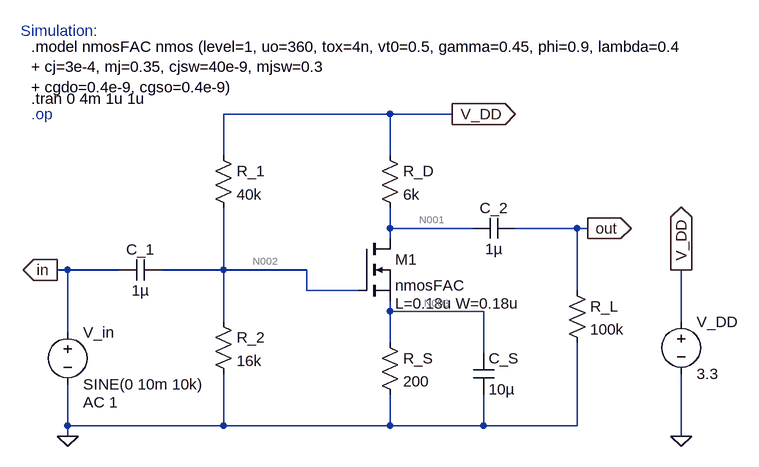
[diagram p0: schematic Homework 3 - Simulation.asc]
Homework 3 - Simulation.asc, the LTspice schematic file:
Version 4
SHEET 1 1324 680
WIRE 528 -176 272 -176
WIRE 624 -176 528 -176
WIRE 272 -112 272 -176
WIRE 528 -112 528 -176
WIRE 528 0 528 -32
WIRE 656 0 528 0
WIRE 816 0 720 0
WIRE 832 0 816 0
WIRE 528 16 528 0
WIRE 32 64 16 64
WIRE 112 64 32 64
WIRE 272 64 272 -32
WIRE 272 64 176 64
WIRE 400 64 272 64
WIRE 400 96 400 64
WIRE 480 96 400 96
WIRE 816 96 816 0
WIRE 528 128 528 112
WIRE 672 128 528 128
WIRE 272 144 272 64
WIRE 976 144 976 64
WIRE 32 160 32 64
WIRE 528 176 528 128
WIRE 672 192 672 128
WIRE 32 304 32 240
WIRE 272 304 272 224
WIRE 272 304 32 304
WIRE 528 304 528 256
WIRE 528 304 272 304
WIRE 672 304 672 256
WIRE 672 304 528 304
WIRE 816 304 816 176
WIRE 816 304 672 304
WIRE 32 320 32 304
WIRE 976 320 976 224
FLAG 32 320 0
FLAG 832 0 out
IOPIN 832 0 Out
FLAG 16 64 in
IOPIN 16 64 Out
FLAG 624 -176 V_DD
IOPIN 624 -176 Out
FLAG 976 64 V_DD
IOPIN 976 64 Out
FLAG 976 320 0
SYMBOL voltage 32 144 R0
WINDOW 123 24 124 Left 2
WINDOW 39 0 0 Left 0
SYMATTR InstName V_in
SYMATTR Value SINE(0 10m 10k)
SYMATTR Value2 AC 1
SYMBOL cap 112 80 R270
WINDOW 0 32 32 VTop 2
WINDOW 3 0 32 VBottom 2
SYMATTR InstName C_1
SYMATTR Value 1µ
SYMBOL res 256 -128 R0
SYMATTR InstName R_1
SYMATTR Value 40k
SYMBOL res 256 128 R0
SYMATTR InstName R_2
SYMATTR Value 16k
SYMBOL nmos 480 16 R0
WINDOW 123 56 100 Left 2
SYMATTR InstName M1
SYMATTR Value nmosFAC
SYMATTR Value2 L=0.18u W=0.18u
SYMBOL res 512 -128 R0
SYMATTR InstName R_D
SYMATTR Value 6k
SYMBOL res 512 160 R0
SYMATTR InstName R_S
SYMATTR Value 200
SYMBOL cap 656 192 R0
SYMATTR InstName C_S
SYMATTR Value 10µ
SYMBOL cap 720 -16 R90
WINDOW 0 0 32 VBottom 2
WINDOW 3 32 32 VTop 2
SYMATTR InstName C_2
SYMATTR Value 1µ
SYMBOL res 800 80 R0
SYMATTR InstName R_L
SYMATTR Value 100k
SYMBOL voltage 976 128 R0
SYMATTR InstName V_DD
SYMATTR Value 3.3
TEXT -40 -304 Left 2 ;Simulation:
TEXT -24 -280 Left 2 !.model nmosFAC nmos (level=1, uo=360, tox=4n, vt0=0.5, gamma=0.45, phi=0.9, lambda=0.4\n+ cj=3e-4, mj=0.35, cjsw=40e-9, mjsw=0.3\n+ cgdo=0.4e-9, cgso=0.4e-9)
TEXT -24 -176 Left 2 ;.op
TEXT -24 -200 Left 2 !.tran 0 4m 1u 1u

The netlist it stands for:
* Homework 3 - Simulation.asc
V_in in 0 SINE(0 10m 10k) AC 1
C_1 in N002 1µ
R_1 V_DD N002 40k
R_2 N002 0 16k
M1 N001 N002 N003 N003 nmosFAC L=0.18u W=0.18u
R_D V_DD N001 6k
R_S N003 0 200
C_S N003 0 10µ
C_2 out N001 1µ
R_L out 0 100k
V_DD V_DD 0 3.3
.model NMOS NMOS
.model PMOS PMOS
.lib standard.mos
* Simulation:
.model nmosFAC nmos (level=1, uo=360, tox=4n, vt0=0.5, gamma=0.45, phi=0.9, lambda=0.4
+ cj=3e-4, mj=0.35, cjsw=40e-9, mjsw=0.3
+ cgdo=0.4e-9, cgso=0.4e-9)
* .op
.tran 0 4m 1u 1u
.backanno
.end

* Results of the author's LTspice run, read from the files saved beside the schematic
* Operating Point, zero values left out:
*   V(n002) = 942.9 mV
*   V(v_dd) = 3.3 V
*   V(n001) = 2.926 V
*   V(n003) = 12.47 mV
*   Id(M1) = 62.33 µA
*   Ib(M1) = -2.924 pA
*   Is(M1) = -62.33 µA
*   I(R_1) = 58.93 µA
*   I(R_2) = 58.93 µA
*   I(R_d) = 62.33 µA
*   I(R_s) = 62.33 µA
*   I(V_dd) = -121.3 µA
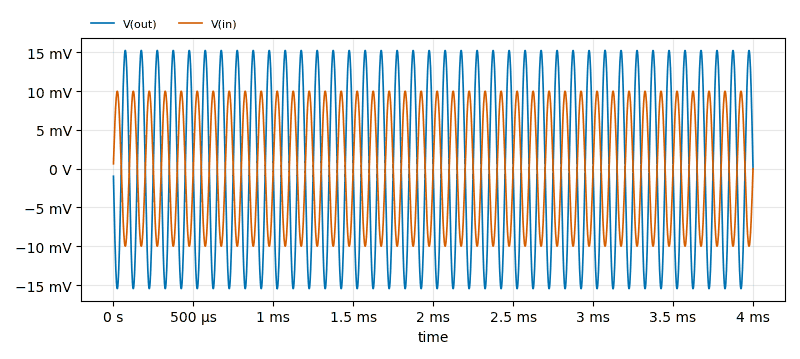
[diagram p1: Transient Analysis of Homework 3 - Simulation.asc, plotted from the saved traces]
* Transient Analysis, 1 run:
*   V(out): min -15.49 mV, max 15.26 mV, average -41.85 µV, rms 10.88 mV, last -8.45 µV
*   V(in): min -10 mV, max 10 mV, average -109.4 nV, rms 7.075 mV, last 0 V